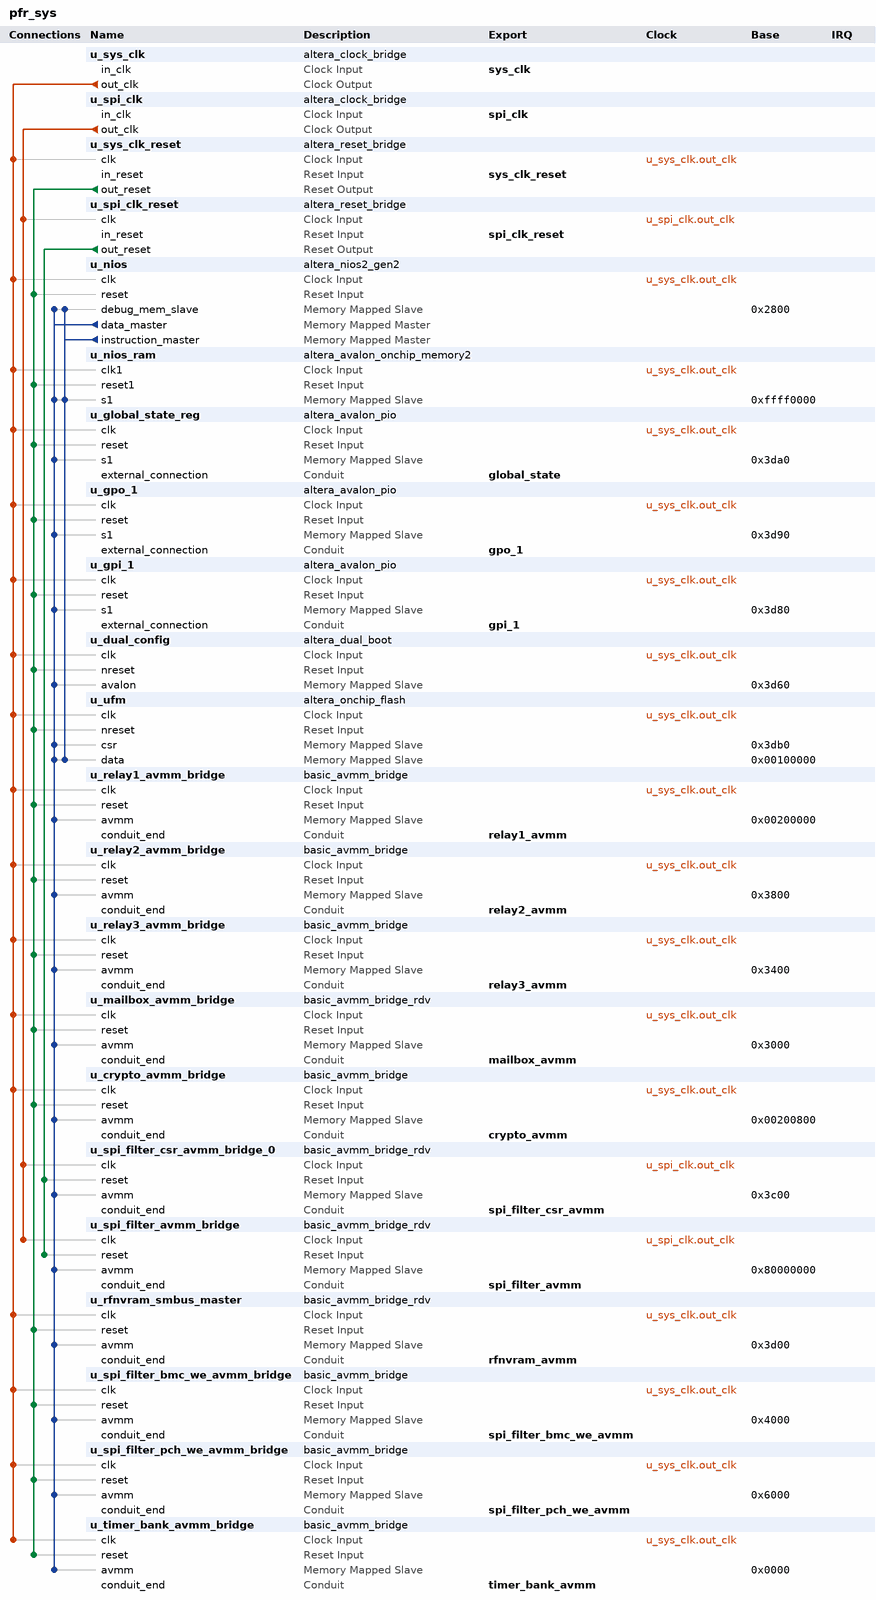
[diagram p0: system contents]
# Platform Designer (Qsys) system pfr_sys, MAX 10 10M16SAU324I7G
# Parameters at their usual value, and those the tool derives, are not listed.
package require -exact qsys 18.1
create_system pfr_sys
set_project_property DEVICE_FAMILY {MAX 10}
set_project_property DEVICE 10M16SAU324I7G

add_instance u_sys_clk altera_clock_bridge 18.1
set_instance_parameter_value u_sys_clk DERIVED_CLOCK_RATE 0
set_instance_parameter_value u_sys_clk EXPLICIT_CLOCK_RATE 50000000

add_instance u_spi_clk altera_clock_bridge 18.1
set_instance_parameter_value u_spi_clk DERIVED_CLOCK_RATE 0
set_instance_parameter_value u_spi_clk EXPLICIT_CLOCK_RATE 80000000

add_instance u_sys_clk_reset altera_reset_bridge 18.1
set_instance_parameter_value u_sys_clk_reset ACTIVE_LOW_RESET 0
set_instance_parameter_value u_sys_clk_reset SYNCHRONOUS_EDGES deassert

add_instance u_spi_clk_reset altera_reset_bridge 18.1
set_instance_parameter_value u_spi_clk_reset ACTIVE_LOW_RESET 0
set_instance_parameter_value u_spi_clk_reset SYNCHRONOUS_EDGES deassert

add_instance u_nios altera_nios2_gen2 18.1
set_instance_parameter_value u_nios dcache_size 0
set_instance_parameter_value u_nios debug_hwbreakpoint 4
set_instance_parameter_value u_nios exceptionOffset 262176
set_instance_parameter_value u_nios exceptionSlave u_ufm.data
set_instance_parameter_value u_nios icache_size 0
set_instance_parameter_value u_nios impl Tiny
set_instance_parameter_value u_nios resetOffset 262144
set_instance_parameter_value u_nios resetSlave u_ufm.data
set_instance_parameter_value u_nios resetrequest_enabled false
set_instance_parameter_value u_nios setting_activateTrace true
set_instance_parameter_value u_nios setting_support31bitdcachebypass false

add_instance u_nios_ram altera_avalon_onchip_memory2 18.1
set_instance_parameter_value u_nios_ram dataWidth 32
set_instance_parameter_value u_nios_ram dualPort false
set_instance_parameter_value u_nios_ram initMemContent false
set_instance_parameter_value u_nios_ram initializationFileName onchip_mem.hex
set_instance_parameter_value u_nios_ram memorySize 13312

add_instance u_global_state_reg altera_avalon_pio 18.1
set_instance_parameter_value u_global_state_reg direction Output
set_instance_parameter_value u_global_state_reg width 32

add_instance u_gpo_1 altera_avalon_pio 18.1
set_instance_parameter_value u_gpo_1 direction Output
set_instance_parameter_value u_gpo_1 width 32

add_instance u_gpi_1 altera_avalon_pio 18.1
set_instance_parameter_value u_gpi_1 direction Input
set_instance_parameter_value u_gpi_1 width 32

add_instance u_dual_config altera_dual_boot 18.1
set_instance_parameter_value u_dual_config CLOCK_FREQUENCY 80.0

add_instance u_ufm altera_onchip_flash 18.1
set_instance_parameter_value u_ufm CLOCK_FREQUENCY 100.0
set_instance_parameter_value u_ufm CONFIGURATION_MODE {Dual Compressed Images}
set_instance_parameter_value u_ufm READ_BURST_COUNT 2
set_instance_parameter_value u_ufm SECTOR_ACCESS_MODE {Read and write,Read and write,Read and write,Read and write,Read and write}
set_instance_parameter_value u_ufm initFlashContent false
set_instance_parameter_value u_ufm initializationFileName rom_mem.hex
set_instance_parameter_value u_ufm initializationFileNameForSim rom_mem.dat
set_instance_parameter_value u_ufm useNonDefaultInitFile true

add_instance u_relay1_avmm_bridge basic_avmm_bridge 1.0
set_instance_parameter_value u_relay1_avmm_bridge ADDRESS_WIDTH 8

add_instance u_relay2_avmm_bridge basic_avmm_bridge 1.0
set_instance_parameter_value u_relay2_avmm_bridge ADDRESS_WIDTH 8

add_instance u_relay3_avmm_bridge basic_avmm_bridge 1.0
set_instance_parameter_value u_relay3_avmm_bridge ADDRESS_WIDTH 8

add_instance u_mailbox_avmm_bridge basic_avmm_bridge_rdv 1.0
set_instance_parameter_value u_mailbox_avmm_bridge ADDRESS_WIDTH 8

add_instance u_crypto_avmm_bridge basic_avmm_bridge 1.0
set_instance_parameter_value u_crypto_avmm_bridge ADDRESS_WIDTH 7

add_instance u_spi_filter_csr_avmm_bridge_0 basic_avmm_bridge_rdv 1.0
set_instance_parameter_value u_spi_filter_csr_avmm_bridge_0 ADDRESS_WIDTH 6

add_instance u_spi_filter_avmm_bridge basic_avmm_bridge_rdv 1.0
set_instance_parameter_value u_spi_filter_avmm_bridge ADDRESS_WIDTH 25

add_instance u_rfnvram_smbus_master basic_avmm_bridge_rdv 1.0
set_instance_parameter_value u_rfnvram_smbus_master ADDRESS_WIDTH 4

add_instance u_spi_filter_bmc_we_avmm_bridge basic_avmm_bridge 1.0
set_instance_parameter_value u_spi_filter_bmc_we_avmm_bridge ADDRESS_WIDTH 11

add_instance u_spi_filter_pch_we_avmm_bridge basic_avmm_bridge 1.0
set_instance_parameter_value u_spi_filter_pch_we_avmm_bridge ADDRESS_WIDTH 11

add_instance u_timer_bank_avmm_bridge basic_avmm_bridge 1.0
set_instance_parameter_value u_timer_bank_avmm_bridge ADDRESS_WIDTH 11

# connections
add_connection u_spi_clk.out_clk u_spi_clk_reset.clk clock
add_connection u_spi_clk.out_clk u_spi_filter_avmm_bridge.clk clock
add_connection u_spi_clk.out_clk u_spi_filter_csr_avmm_bridge_0.clk clock
add_connection u_sys_clk.out_clk u_crypto_avmm_bridge.clk clock
add_connection u_sys_clk.out_clk u_dual_config.clk clock
add_connection u_sys_clk.out_clk u_global_state_reg.clk clock
add_connection u_sys_clk.out_clk u_gpi_1.clk clock
add_connection u_sys_clk.out_clk u_gpo_1.clk clock
add_connection u_sys_clk.out_clk u_mailbox_avmm_bridge.clk clock
add_connection u_sys_clk.out_clk u_nios.clk clock
add_connection u_sys_clk.out_clk u_nios_ram.clk1 clock
add_connection u_sys_clk.out_clk u_relay1_avmm_bridge.clk clock
add_connection u_sys_clk.out_clk u_relay2_avmm_bridge.clk clock
add_connection u_sys_clk.out_clk u_relay3_avmm_bridge.clk clock
add_connection u_sys_clk.out_clk u_rfnvram_smbus_master.clk clock
add_connection u_sys_clk.out_clk u_spi_filter_bmc_we_avmm_bridge.clk clock
add_connection u_sys_clk.out_clk u_spi_filter_pch_we_avmm_bridge.clk clock
add_connection u_sys_clk.out_clk u_sys_clk_reset.clk clock
add_connection u_sys_clk.out_clk u_timer_bank_avmm_bridge.clk clock
add_connection u_sys_clk.out_clk u_ufm.clk clock
add_connection u_spi_clk_reset.out_reset u_spi_filter_avmm_bridge.reset reset
add_connection u_spi_clk_reset.out_reset u_spi_filter_csr_avmm_bridge_0.reset reset
add_connection u_sys_clk_reset.out_reset u_crypto_avmm_bridge.reset reset
add_connection u_sys_clk_reset.out_reset u_dual_config.nreset reset
add_connection u_sys_clk_reset.out_reset u_global_state_reg.reset reset
add_connection u_sys_clk_reset.out_reset u_gpi_1.reset reset
add_connection u_sys_clk_reset.out_reset u_gpo_1.reset reset
add_connection u_sys_clk_reset.out_reset u_mailbox_avmm_bridge.reset reset
add_connection u_sys_clk_reset.out_reset u_nios.reset reset
add_connection u_sys_clk_reset.out_reset u_nios_ram.reset1 reset
add_connection u_sys_clk_reset.out_reset u_relay1_avmm_bridge.reset reset
add_connection u_sys_clk_reset.out_reset u_relay2_avmm_bridge.reset reset
add_connection u_sys_clk_reset.out_reset u_relay3_avmm_bridge.reset reset
add_connection u_sys_clk_reset.out_reset u_rfnvram_smbus_master.reset reset
add_connection u_sys_clk_reset.out_reset u_spi_filter_bmc_we_avmm_bridge.reset reset
add_connection u_sys_clk_reset.out_reset u_spi_filter_pch_we_avmm_bridge.reset reset
add_connection u_sys_clk_reset.out_reset u_timer_bank_avmm_bridge.reset reset
add_connection u_sys_clk_reset.out_reset u_ufm.nreset reset
add_connection u_nios.data_master u_crypto_avmm_bridge.avmm avalon
set_connection_parameter_value u_nios.data_master/u_crypto_avmm_bridge.avmm baseAddress 0x00200800
add_connection u_nios.data_master u_dual_config.avalon avalon
set_connection_parameter_value u_nios.data_master/u_dual_config.avalon baseAddress 0x3d60
add_connection u_nios.data_master u_global_state_reg.s1 avalon
set_connection_parameter_value u_nios.data_master/u_global_state_reg.s1 baseAddress 0x3da0
add_connection u_nios.data_master u_gpi_1.s1 avalon
set_connection_parameter_value u_nios.data_master/u_gpi_1.s1 baseAddress 0x3d80
add_connection u_nios.data_master u_gpo_1.s1 avalon
set_connection_parameter_value u_nios.data_master/u_gpo_1.s1 baseAddress 0x3d90
add_connection u_nios.data_master u_mailbox_avmm_bridge.avmm avalon
set_connection_parameter_value u_nios.data_master/u_mailbox_avmm_bridge.avmm baseAddress 0x3000
add_connection u_nios.data_master u_nios.debug_mem_slave avalon
set_connection_parameter_value u_nios.data_master/u_nios.debug_mem_slave baseAddress 0x2800
add_connection u_nios.data_master u_nios_ram.s1 avalon
set_connection_parameter_value u_nios.data_master/u_nios_ram.s1 baseAddress 0xffff0000
add_connection u_nios.data_master u_relay1_avmm_bridge.avmm avalon
set_connection_parameter_value u_nios.data_master/u_relay1_avmm_bridge.avmm baseAddress 0x00200000
add_connection u_nios.data_master u_relay2_avmm_bridge.avmm avalon
set_connection_parameter_value u_nios.data_master/u_relay2_avmm_bridge.avmm baseAddress 0x3800
add_connection u_nios.data_master u_relay3_avmm_bridge.avmm avalon
set_connection_parameter_value u_nios.data_master/u_relay3_avmm_bridge.avmm baseAddress 0x3400
add_connection u_nios.data_master u_rfnvram_smbus_master.avmm avalon
set_connection_parameter_value u_nios.data_master/u_rfnvram_smbus_master.avmm baseAddress 0x3d00
add_connection u_nios.data_master u_spi_filter_avmm_bridge.avmm avalon
set_connection_parameter_value u_nios.data_master/u_spi_filter_avmm_bridge.avmm baseAddress 0x80000000
add_connection u_nios.data_master u_spi_filter_bmc_we_avmm_bridge.avmm avalon
set_connection_parameter_value u_nios.data_master/u_spi_filter_bmc_we_avmm_bridge.avmm baseAddress 0x4000
add_connection u_nios.data_master u_spi_filter_csr_avmm_bridge_0.avmm avalon
set_connection_parameter_value u_nios.data_master/u_spi_filter_csr_avmm_bridge_0.avmm baseAddress 0x3c00
add_connection u_nios.data_master u_spi_filter_pch_we_avmm_bridge.avmm avalon
set_connection_parameter_value u_nios.data_master/u_spi_filter_pch_we_avmm_bridge.avmm baseAddress 0x6000
add_connection u_nios.data_master u_timer_bank_avmm_bridge.avmm avalon
set_connection_parameter_value u_nios.data_master/u_timer_bank_avmm_bridge.avmm baseAddress 0x0000
add_connection u_nios.data_master u_ufm.csr avalon
set_connection_parameter_value u_nios.data_master/u_ufm.csr baseAddress 0x3db0
add_connection u_nios.data_master u_ufm.data avalon
set_connection_parameter_value u_nios.data_master/u_ufm.data baseAddress 0x00100000
add_connection u_nios.instruction_master u_nios.debug_mem_slave avalon
set_connection_parameter_value u_nios.instruction_master/u_nios.debug_mem_slave baseAddress 0x2800
add_connection u_nios.instruction_master u_nios_ram.s1 avalon
set_connection_parameter_value u_nios.instruction_master/u_nios_ram.s1 baseAddress 0xffff0000
add_connection u_nios.instruction_master u_ufm.data avalon
set_connection_parameter_value u_nios.instruction_master/u_ufm.data baseAddress 0x00100000

# exported interfaces
add_interface crypto_avmm conduit end
set_interface_property crypto_avmm EXPORT_OF u_crypto_avmm_bridge.conduit_end
add_interface global_state conduit end
set_interface_property global_state EXPORT_OF u_global_state_reg.external_connection
add_interface gpi_1 conduit end
set_interface_property gpi_1 EXPORT_OF u_gpi_1.external_connection
add_interface gpo_1 conduit end
set_interface_property gpo_1 EXPORT_OF u_gpo_1.external_connection
add_interface mailbox_avmm conduit end
set_interface_property mailbox_avmm EXPORT_OF u_mailbox_avmm_bridge.conduit_end
add_interface relay1_avmm conduit end
set_interface_property relay1_avmm EXPORT_OF u_relay1_avmm_bridge.conduit_end
add_interface relay2_avmm conduit end
set_interface_property relay2_avmm EXPORT_OF u_relay2_avmm_bridge.conduit_end
add_interface relay3_avmm conduit end
set_interface_property relay3_avmm EXPORT_OF u_relay3_avmm_bridge.conduit_end
add_interface rfnvram_avmm conduit end
set_interface_property rfnvram_avmm EXPORT_OF u_rfnvram_smbus_master.conduit_end
add_interface spi_clk clock sink
set_interface_property spi_clk EXPORT_OF u_spi_clk.in_clk
add_interface spi_clk_reset reset sink
set_interface_property spi_clk_reset EXPORT_OF u_spi_clk_reset.in_reset
add_interface spi_filter_avmm conduit end
set_interface_property spi_filter_avmm EXPORT_OF u_spi_filter_avmm_bridge.conduit_end
add_interface spi_filter_bmc_we_avmm conduit end
set_interface_property spi_filter_bmc_we_avmm EXPORT_OF u_spi_filter_bmc_we_avmm_bridge.conduit_end
add_interface spi_filter_csr_avmm conduit end
set_interface_property spi_filter_csr_avmm EXPORT_OF u_spi_filter_csr_avmm_bridge_0.conduit_end
add_interface spi_filter_pch_we_avmm conduit end
set_interface_property spi_filter_pch_we_avmm EXPORT_OF u_spi_filter_pch_we_avmm_bridge.conduit_end
add_interface sys_clk clock sink
set_interface_property sys_clk EXPORT_OF u_sys_clk.in_clk
add_interface sys_clk_reset reset sink
set_interface_property sys_clk_reset EXPORT_OF u_sys_clk_reset.in_reset
add_interface timer_bank_avmm conduit end
set_interface_property timer_bank_avmm EXPORT_OF u_timer_bank_avmm_bridge.conduit_end

set_interconnect_requirement {$system} qsys_mm.clockCrossingAdapter HANDSHAKE
set_interconnect_requirement {$system} qsys_mm.enableEccProtection FALSE
set_interconnect_requirement {$system} qsys_mm.insertDefaultSlave FALSE
set_interconnect_requirement {$system} qsys_mm.maxAdditionalLatency 1

save_system pfr_sys.qsys
